# Altium schematic sheet Motor_Driver_Sheet1.SchDoc (part 1 of 2)
size 420 x 297 mm; SheetNumber: 9; SheetTotal: 26
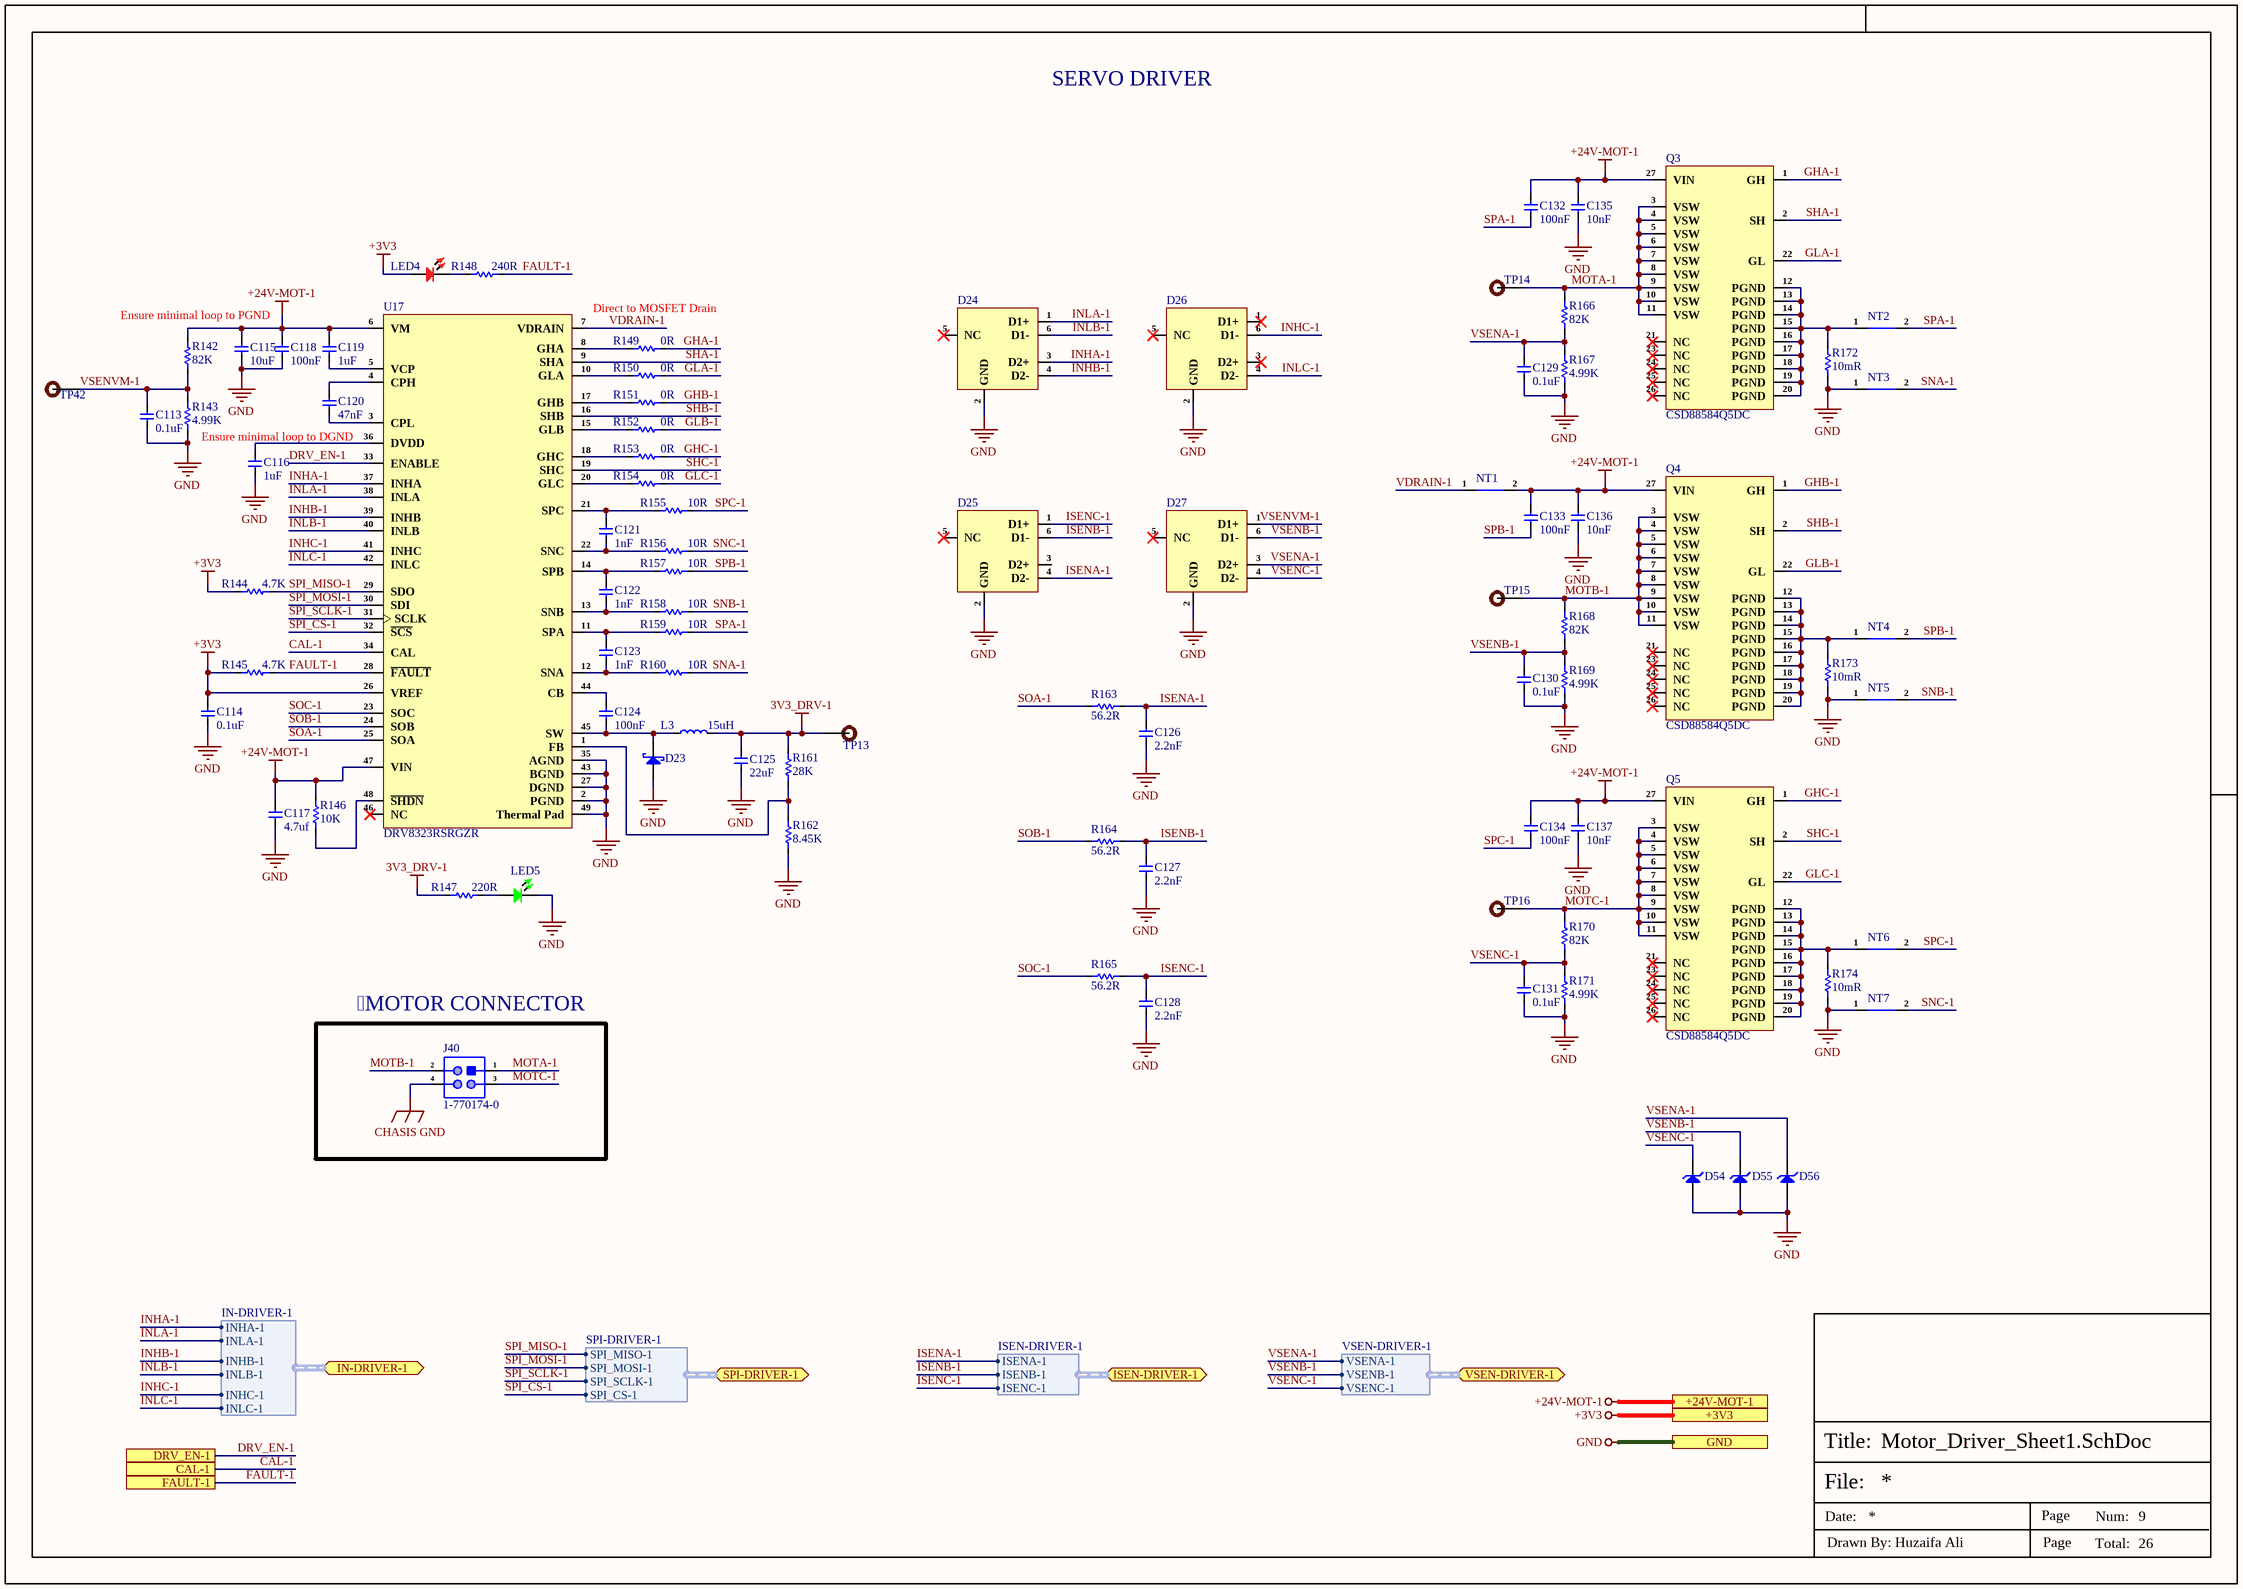
[diagram p0: Motor_Driver_Sheet1.SchDoc]

## Parts
C113  0.1uF  [Cap-0402]
C114  0.1uF  [Cap-0402]
C115  10uF  [Cap-1206]
C116  1uF  [Cap-0603]
C117  4.7uf  [Cap-0805]
C118  100nF  [Cap-0603]
C119  1uF  [Cap-0603]
C120  47nF  [Cap-0402]
C121  1nF  [Cap-0402]
C122  1nF  [Cap-0402]
C123  1nF  [Cap-0402]
C124  100nF  [Cap-0603]
C125  22uF  [Cap-0603]
C126  2.2nF  [Cap-0603]
C127  2.2nF  [Cap-0603]
C128  2.2nF  [Cap-0603]
C129  0.1uF  [Cap-0402]
C130  0.1uF  [Cap-0402]
C131  0.1uF  [Cap-0402]
C132  100nF  [Cap-0603]
C133  100nF  [Cap-0603]
C134  100nF  [Cap-0603]
C135  10nF  [Cap-0402]
C136  10nF  [Cap-0402]
C137  10nF  [Cap-0402]
D23  SS24A  [SMA]  (value not drawn)
D24  TPD4E1U06DCKR  [SOT-363]  (value not drawn)
D25  TPD4E1U06DCKR  [SOT-363]  (value not drawn)
D26  TPD4E1U06DCKR  [SOT-363]  (value not drawn)
D27  TPD4E1U06DCKR  [SOT-363]  (value not drawn)
D54  MM3Z3V3B  [SOD323F]  (value not drawn)
D55  MM3Z3V3B  [SOD323F]  (value not drawn)
D56  MM3Z3V3B  [SOD323F]  (value not drawn)
J40  1-770174-0  [1-770174-0]
L3  15uH  [FEXL0550A-150M]
LED4  RED  [LED-0603]  (value not drawn)
LED5  Emerald  [LED-0603]  (value not drawn)
NT1  Net Tie_SMD  [Net Tie Pad]  (value not drawn)  (net tie, no BOM)
NT2  Net Tie_SMD  [Net Tie Pad]  (value not drawn)  (net tie, no BOM)
NT3  Net Tie_SMD  [Net Tie Pad]  (value not drawn)  (net tie, no BOM)
NT4  Net Tie_SMD  [Net Tie Pad]  (value not drawn)  (net tie, no BOM)
NT5  Net Tie_SMD  [Net Tie Pad]  (value not drawn)  (net tie, no BOM)
NT6  Net Tie_SMD  [Net Tie Pad]  (value not drawn)  (net tie, no BOM)
NT7  Net Tie_SMD  [Net Tie Pad]  (value not drawn)  (net tie, no BOM)
Q3  CSD88584Q5DC  [22-VSON-CLIP (5x6)]
Q4  CSD88584Q5DC  [22-VSON-CLIP (5x6)]
Q5  CSD88584Q5DC  [22-VSON-CLIP (5x6)]
R142  82K  [Res-0603]
R143  4.99K  [Res-0603]
R144  4.7K  [Res-0402]
R145  4.7K  [Res-0402]
R146  10K  [Res-0402]
R147  220R  [Res-0603]
R148  240R  [Res-0402]
R149  0R  [Res-0402]
R150  0R  [Res-0402]
R151  0R  [Res-0402]
R152  0R  [Res-0402]
R153  0R  [Res-0402]
R154  0R  [Res-0402]
R155  10R  [Res-0603]
R156  10R  [Res-0603]
R157  10R  [Res-0603]
R158  10R  [Res-0603]
R159  10R  [Res-0603]
R160  10R  [Res-0603]
R161  28K  [Res-0402]
R162  8.45K  [Res-0402]
R163  56.2R  [Res-0603]
R164  56.2R  [Res-0603]
R165  56.2R  [Res-0603]
R166  82K  [Res-0603]
R167  4.99K  [Res-0603]
R168  82K  [Res-0603]
R169  4.99K  [Res-0603]
R170  82K  [Res-0603]
R171  4.99K  [Res-0603]
R172  10mR  [RES-2512]
R173  10mR  [RES-2512]
R174  10mR  [RES-2512]
TP13  TEST POINT 0.5mm Dia  [Test-point - 0.5mm]  (value not drawn)  (no BOM)
TP14  TEST POINT 0.5mm Dia  [Test-point - 0.5mm]  (value not drawn)  (no BOM)
TP15  TEST POINT 0.5mm Dia  [Test-point - 0.5mm]  (value not drawn)  (no BOM)
TP16  TEST POINT 0.5mm Dia  [Test-point - 0.5mm]  (value not drawn)  (no BOM)
TP42  TEST POINT 0.5mm Dia  [Test-point - 0.5mm]  (value not drawn)  (no BOM)
U17  DRV8323RSRGZR  [48-VQFN (7x7)]

## Ports
+3V3 (see Servo1[2A], CAN_Sheet[4D], Controller_Sheet[5D], DIO_1[5D], DIO_2[5D], DIO_3[5D], DIO_4[5D], Encoder_Sheet1[5D], Encoder_Sheet2[4D], Encoder_Sheet3[4D], Encoder_Sheet4[5D], EtherCAT_Sheet[5D], Motor_Driver_Sheet2[5D], Motor_Driver_Sheet3[5D], Motor_Driver_Sheet4[5D], Power_Sheet[5D], RS485_RS232_Sheet[5D], Sec_Controller_Sheet1[5D], Sec_Controller_Sheet2[5D], Sec_Controller_Sheet3[5D], Sec_Controller_Sheet4[5D], Servo1[5D], Servo2[5D], Servo3[5D], Servo4[5D]), +24V-MOT-1 (see Servo1[2A], Power_Sheet[5D], Servo1[5D]), CAL-1 (see Servo1[2B], Sec_Controller_Sheet1[2D]), DRV_EN-1 (see Servo1[2B], Sec_Controller_Sheet1[2D]), FAULT-1 (see Servo1[2B], Sec_Controller_Sheet1[2D]), GND (see Servo1[2B], CAN_Sheet[4D], Controller_Sheet[5D], DIO_1[5D], DIO_2[5D], DIO_3[5D], DIO_4[5D], Encoder_Sheet1[5D], Encoder_Sheet2[4D], Encoder_Sheet3[4D], Encoder_Sheet4[5D], EtherCAT_Sheet[5D], Motor_Driver_Sheet2[5D], Motor_Driver_Sheet3[5D], Motor_Driver_Sheet4[5D], Power_Sheet[5D], RS485_RS232_Sheet[5D], Sec_Controller_Sheet1[5D], Sec_Controller_Sheet2[5D], Sec_Controller_Sheet3[5D], Sec_Controller_Sheet4[5D], Servo1[5D], Servo2[5D], Servo3[5D], Servo4[5D]), IN-DRIVER-1 (bidir, harness IN-DRIVER-1, see Servo1[2B], Sec_Controller_Sheet1[2D]), ISEN-DRIVER-1 (bidir, harness ISEN-DRIVER-1, see Servo1[2B], Sec_Controller_Sheet1[2D]), SPI-DRIVER-1 (bidir, harness SPI-DRIVER-1, see Servo1[2B], Sec_Controller_Sheet1[2D]), VSEN-DRIVER-1 (bidir, harness VSEN-DRIVER-1, see Servo1[2B], Sec_Controller_Sheet1[3C])

## Harnesses
IN-DRIVER-1: INHA-1, INLA-1, INHB-1, INLB-1, INHC-1, INLC-1
SPI-DRIVER-1: SPI_MISO-1, SPI_MOSI-1, SPI_SCLK-1, SPI_CS-1
ISEN-DRIVER-1: ISENA-1, ISENB-1, ISENC-1
VSEN-DRIVER-1: VSENA-1, VSENB-1, VSENC-1

## Nets
3V3_DRV-1: C125.2 L3.2 R147.1 R161.2 TP13.1
+3V3: C114.2 LED4.1 R144.1 R145.1 U17.26(VREF) ; port +3V3
+24V-MOT-1: C115.2 C117.2 C118.2 C119.2 C132.2 C133.2 C134.2 C135.2 C136.2 C137.2 NT1.2 Q3.27(VIN) Q4.27(VIN) Q5.27(VIN) R142.2 R146.1 U17.6(VM) U17.47(VIN) ; port +24V-MOT-1
CHASIS GND: J40.4
GND: C113.1 C114.1 C115.1 C116.1 C117.1 C118.1 C125.1 C126.1 C127.1 C128.1 C129.1 C130.1 C131.1 C135.1 C136.1 C137.1 D23.2(A) D24.2(GND) D25.2(GND) D26.2(GND) D27.2(GND) D54.1(A) D55.1(A) D56.1(A) LED5.2 NT3.1 NT5.1 NT7.1 R143.1 R162.1 R167.1 R169.1 R171.1 R172.1 R173.1 R174.1 U17.2(PGND) U17.27(DGND) U17.35(AGND) U17.43(BGND) U17.49(Thermal_Pad) ; port GND
CAL-1: U17.34(CAL) ; port CAL-1
DRV_EN-1: U17.33(ENABLE) ; port DRV_EN-1
FAULT-1: R145.2 R148.2 U17.28(~{FAULT}) ; port FAULT-1
GHA-1: Q3.1(GH) R149.2
GHB-1: Q4.1(GH) R151.2
GHC-1: Q5.1(GH) R153.2
GLA-1: Q3.22(GL) R150.2
GLB-1: Q4.22(GL) R152.2
GLC-1: Q5.22(GL) R154.2
INHA-1: D24.3(D2+) U17.37(INHA) ; port IN-DRIVER-1.INHA-1
INHB-1: D24.4(D2-) U17.39(INHB) ; port IN-DRIVER-1.INHB-1
INHC-1: D26.6(D1-) U17.41(INHC) ; port IN-DRIVER-1.INHC-1
INLA-1: D24.1(D1+) U17.38(INLA) ; port IN-DRIVER-1.INLA-1
INLB-1: D24.6(D1-) U17.40(INLB) ; port IN-DRIVER-1.INLB-1
INLC-1: D26.4(D2-) U17.42(INLC) ; port IN-DRIVER-1.INLC-1
ISENA-1: C126.2 D25.4(D2-) R163.2 ; port ISEN-DRIVER-1.ISENA-1
ISENB-1: C127.2 D25.6(D1-) R164.2 ; port ISEN-DRIVER-1.ISENB-1
ISENC-1: C128.2 D25.1(D1+) R165.2 ; port ISEN-DRIVER-1.ISENC-1
MOTA-1: J40.1 Q3.3(VSW) Q3.4(VSW) Q3.5(VSW) Q3.6(VSW) Q3.7(VSW) Q3.8(VSW) Q3.9(VSW) Q3.10(VSW) Q3.11(VSW) R166.2 TP14.1
MOTB-1: J40.2 Q4.3(VSW) Q4.4(VSW) Q4.5(VSW) Q4.6(VSW) Q4.7(VSW) Q4.8(VSW) Q4.9(VSW) Q4.10(VSW) Q4.11(VSW) R168.2 TP15.1
MOTC-1: J40.3 Q5.3(VSW) Q5.4(VSW) Q5.5(VSW) Q5.6(VSW) Q5.7(VSW) Q5.8(VSW) Q5.9(VSW) Q5.10(VSW) Q5.11(VSW) R170.2 TP16.1
SHA-1: Q3.2(SH) U17.9(SHA)
SHB-1: Q4.2(SH) U17.16(SHB)
SHC-1: Q5.2(SH) U17.19(SHC)
SNA-1: NT3.2 R160.2
SNB-1: NT5.2 R158.2
SNC-1: NT7.2 R156.2
SOA-1: R163.1 U17.25(SOA)
SOB-1: R164.1 U17.24(SOB)
SOC-1: R165.1 U17.23(SOC)
SPA-1: C132.1 NT2.2 R159.2
SPB-1: C133.1 NT4.2 R157.2
SPC-1: C134.1 NT6.2 R155.2
SPI_CS-1: U17.32(~{SCS}) ; port SPI-DRIVER-1.SPI_CS-1
SPI_MISO-1: R144.2 U17.29(SDO) ; port SPI-DRIVER-1.SPI_MISO-1
SPI_MOSI-1: U17.30(SDI) ; port SPI-DRIVER-1.SPI_MOSI-1
SPI_SCLK-1: U17.31(SCLK) ; port SPI-DRIVER-1.SPI_SCLK-1
VDRAIN-1: NT1.1 U17.7(VDRAIN)
VSENA-1: C129.2 D27.3(D2+) D56.2(K) R166.1 R167.2 ; port VSEN-DRIVER-1.VSENA-1
VSENB-1: C130.2 D27.6(D1-) D55.2(K) R168.1 R169.2 ; port VSEN-DRIVER-1.VSENB-1
VSENC-1: C131.2 D27.4(D2-) D54.2(K) R170.1 R171.2 ; port VSEN-DRIVER-1.VSENC-1
VSENVM-1: C113.2 D27.1(D1+) R142.1 R143.2 TP42.1
NetC116_2: C116.2 U17.36(DVDD)
NetC119_1: C119.1 U17.5(VCP)
NetC120_1: C120.1 U17.3(CPL)
NetC120_2: C120.2 U17.4(CPH)
NetC121_1: C121.1 R156.1 U17.22(SNC)
NetC121_2: C121.2 R155.1 U17.21(SPC)
NetC122_1: C122.1 R158.1 U17.13(SNB)
NetC122_2: C122.2 R157.1 U17.14(SPB)
NetC123_1: C123.1 R160.1 U17.12(SNA)
NetC123_2: C123.2 R159.1 U17.11(SPA)
NetC124_1: C124.1 D23.1(K) L3.1 U17.45(SW)
NetC124_2: C124.2 U17.44(CB)
NetLED4_2: LED4.2 R148.1
NetLED5_1: LED5.1 R147.2
NetNT2_1: NT2.1 Q3.12(PGND) Q3.13(PGND) Q3.14(PGND) Q3.15(PGND) Q3.16(PGND) Q3.17(PGND) Q3.18(PGND) Q3.19(PGND) Q3.20(PGND) R172.2
NetNT4_1: NT4.1 Q4.12(PGND) Q4.13(PGND) Q4.14(PGND) Q4.15(PGND) Q4.16(PGND) Q4.17(PGND) Q4.18(PGND) Q4.19(PGND) Q4.20(PGND) R173.2
NetNT6_1: NT6.1 Q5.12(PGND) Q5.13(PGND) Q5.14(PGND) Q5.15(PGND) Q5.16(PGND) Q5.17(PGND) Q5.18(PGND) Q5.19(PGND) Q5.20(PGND) R174.2
NetR146_2: R146.2 U17.48(~{SHDN})
NetR149_1: R149.1 U17.8(GHA)
NetR150_1: R150.1 U17.10(GLA)
NetR151_1: R151.1 U17.17(GHB)
NetR152_1: R152.1 U17.15(GLB)
NetR153_1: R153.1 U17.18(GHC)
NetR154_1: R154.1 U17.20(GLC)
NetR161_1: R161.1 R162.2 U17.1(FB)

Not connected (* = marked no-connect by the designer): D24 5(NC)*; D25 3(D2+) 5(NC)*; D26 1(D1+)* 3(D2+)* 5(NC)*; D27 5(NC)*; Q3 21(NC)* 23(NC)* 24(NC)* 25(NC)* 26(NC)*; Q4 21(NC)* 23(NC)* 24(NC)* 25(NC)* 26(NC)*; Q5 21(NC)* 23(NC)* 24(NC)* 25(NC)* 26(NC)*; U17 46(NC)*

## Notes on the sheet
- SERVO DRIVER
- Ensure minimal loop to PGND
- Direct to MOSFET Drain
- Ensure minimal loop to DGND
- MOTOR CONNECTOR
- File:
- Title:
- Date:
- Page
- Num:
- Total:
- Drawn By: Huzaifa Ali